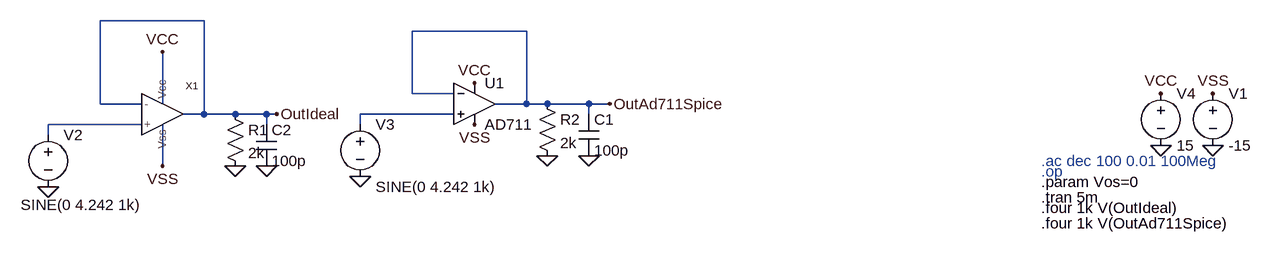
[diagram p0: schematic THD.asc]
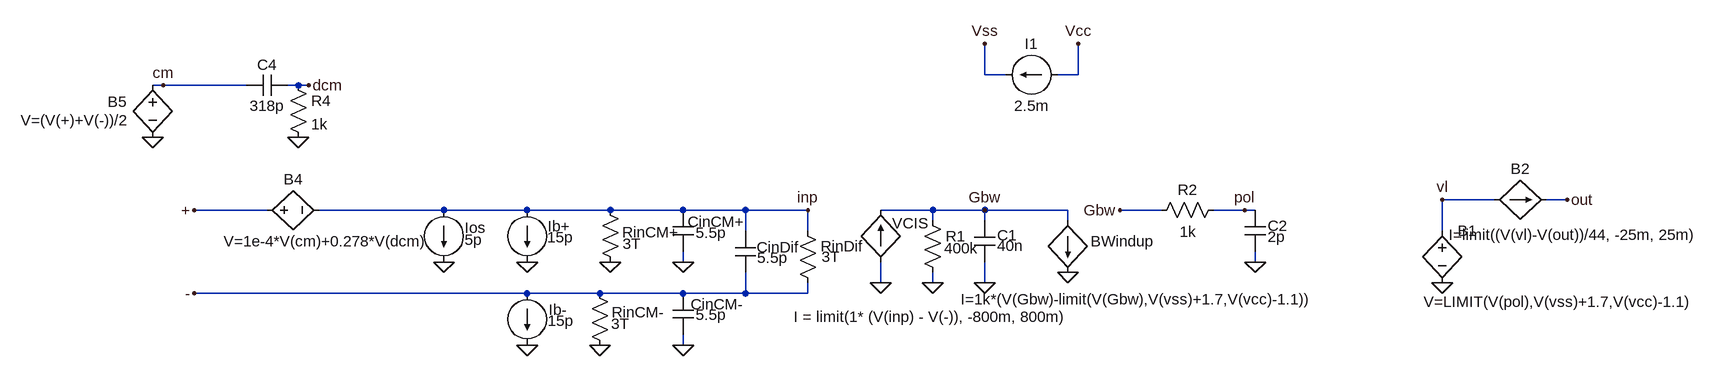
[diagram p1: sub-circuit aoideal.asc]
THD.asc, the LTspice schematic file:
Version 4.1
SHEET 1 1100 680
WIRE -512 -144 -672 -144
WIRE -16 -128 -192 -128
WIRE -192 -32 -192 -128
WIRE -128 -32 -192 -32
WIRE -672 -16 -672 -144
WIRE -608 -16 -672 -16
WIRE -576 -16 -576 -96
WIRE -16 -16 -16 -128
WIRE -16 -16 -64 -16
WIRE 16 -16 -16 -16
WIRE 80 -16 16 -16
WIRE 112 -16 80 -16
WIRE -512 0 -512 -144
WIRE -512 0 -544 0
WIRE -464 0 -512 0
WIRE -416 0 -464 0
WIRE -400 0 -416 0
WIRE -128 0 -272 0
WIRE 80 0 80 -16
WIRE -608 16 -752 16
WIRE -416 16 -416 0
WIRE -272 16 -272 0
WIRE -752 32 -752 16
WIRE -576 80 -576 16
FLAG 960 48 0
FLAG 1040 48 0
FLAG 960 -32 VCC
FLAG 1040 -32 VSS
FLAG -96 -48 VCC
FLAG -576 -96 VCC
FLAG -576 80 VSS
FLAG -96 16 VSS
FLAG -400 0 OutIdeal
FLAG 112 -16 OutAd711Spice
FLAG -752 112 0
FLAG -272 96 0
FLAG 80 64 0
FLAG 16 64 0
FLAG -464 80 0
FLAG -416 80 0
SYMBOL OpAmps\\AD711 -96 -80 R0
SYMATTR InstName U1
SYMBOL AoIdeal -608 0 R0
SYMATTR InstName X1
SYMBOL voltage 1040 -48 R0
SYMATTR InstName V1
SYMATTR Value -15
SYMBOL voltage -752 16 R0
WINDOW 123 -42 124 Left 2
WINDOW 39 0 0 Left 0
SYMATTR Value2 SINE(0 4.242 1k)
SYMATTR InstName V2
SYMATTR Value ""
SYMBOL voltage -272 0 R0
WINDOW 123 24 112 Left 2
WINDOW 39 0 0 Left 0
SYMATTR Value2 SINE(0 4.242 1k)
SYMATTR InstName V3
SYMATTR Value ""
SYMBOL res -480 -16 R0
SYMATTR InstName R1
SYMATTR Value 2k
SYMBOL res 0 -32 R0
SYMATTR InstName R2
SYMATTR Value 2k
SYMBOL cap 64 0 R0
SYMATTR InstName C1
SYMATTR Value 100p
SYMBOL cap -432 16 R0
SYMATTR InstName C2
SYMATTR Value 100p
SYMBOL voltage 960 -48 R0
SYMATTR InstName V4
SYMATTR Value 15
TEXT 776 88 Left 2 ;.op
TEXT 776 72 Left 2 ;.ac dec 100 0.01 100Meg
TEXT 776 104 Left 2 !.param Vos=0
TEXT 776 128 Left 2 !.tran 5m
TEXT 776 144 Left 2 !.four 1k V(OutIdeal)
TEXT 776 168 Left 2 !.four 1k V(OutAd711Spice)

aoideal.asc, the sub-circuit schematic file:
Version 4.1
SHEET 1 2688 1516
WIRE 272 -128 272 -176
WIRE 304 -128 272 -128
WIRE 416 -128 416 -176
WIRE 416 -128 384 -128
WIRE -992 -112 -1008 -112
WIRE -864 -112 -992 -112
WIRE -784 -112 -800 -112
WIRE -768 -112 -784 -112
WIRE 1056 64 976 64
WIRE 1168 64 1136 64
WIRE -832 80 -944 80
WIRE -560 80 -752 80
WIRE -432 80 -560 80
WIRE -304 80 -432 80
WIRE -192 80 -304 80
WIRE -96 80 -192 80
WIRE 0 80 -96 80
WIRE 192 80 112 80
WIRE 272 80 192 80
WIRE 400 80 272 80
WIRE 544 80 480 80
WIRE 672 80 624 80
WIRE 688 80 672 80
WIRE 192 96 192 80
WIRE 272 96 272 80
WIRE 400 96 400 80
WIRE -96 112 -96 80
WIRE 0 112 0 80
WIRE 976 112 976 64
WIRE -192 160 -192 144
WIRE 688 160 688 144
WIRE 112 192 112 160
WIRE 192 192 192 176
WIRE 272 192 272 160
WIRE -432 208 -944 208
WIRE -320 208 -432 208
WIRE -192 208 -320 208
WIRE -96 208 -96 176
WIRE -96 208 -192 208
WIRE 0 208 0 192
WIRE 0 208 -96 208
WIRE -192 288 -192 272
FLAG 112 192 0
FLAG -944 208 -
FLAG -944 80 +
FLAG 192 192 0
FLAG 272 192 0
FLAG -192 160 0
FLAG -304 160 0
FLAG -432 160 0
FLAG -560 160 0
FLAG -432 288 0
FLAG -320 288 0
FLAG -192 288 0
FLAG 0 80 inp
FLAG 272 80 Gbw
FLAG 480 80 Gbw
FLAG 688 160 0
FLAG 672 80 pol
FLAG 976 192 0
FLAG 416 -176 Vcc
FLAG 272 -176 Vss
FLAG 1168 64 out
FLAG 400 176 0
FLAG 976 64 vl
FLAG -1008 -32 0
FLAG -992 -112 cm
FLAG -768 -112 dcm
FLAG -784 -32 0
SYMBOL bi 112 160 R180
WINDOW 0 -73 60 Left 2
WINDOW 3 -289 -84 Left 2
SYMATTR InstName VCIS
SYMATTR Value I = limit(1* (V(inp) - V(-)), -800m, 800m)
SYMBOL res 176 80 R0
WINDOW 3 34 59 Left 2
SYMATTR Value 400k
SYMATTR InstName R1
SYMBOL cap 256 96 R0
WINDOW 0 35 23 Left 2
WINDOW 3 35 39 Left 2
SYMATTR InstName C1
SYMATTR Value 40n
SYMBOL current -560 80 R0
WINDOW 0 32 27 Left 2
WINDOW 3 32 46 Left 2
SYMATTR InstName Ios
SYMATTR Value 5p
SYMBOL current -432 80 R0
WINDOW 0 32 25 Left 2
WINDOW 3 31 42 Left 2
SYMATTR InstName Ib+
SYMATTR Value 15p
SYMBOL current -432 208 R0
WINDOW 0 33 25 Left 2
WINDOW 3 32 42 Left 2
SYMATTR InstName Ib-
SYMATTR Value 15p
SYMBOL res -320 64 R0
WINDOW 0 34 50 Left 2
WINDOW 3 35 68 Left 2
SYMATTR InstName RinCM+
SYMATTR Value 3T
SYMBOL res -336 192 R0
WINDOW 0 34 45 Left 2
WINDOW 3 33 63 Left 2
SYMATTR InstName RinCM-
SYMATTR Value 3T
SYMBOL cap -208 208 R0
WINDOW 0 28 17 Left 2
WINDOW 3 35 33 Left 2
SYMATTR InstName CinCM-
SYMATTR Value 5.5p
SYMBOL cap -208 80 R0
WINDOW 0 23 18 Left 2
WINDOW 3 35 35 Left 2
SYMATTR InstName CinCM+
SYMATTR Value 5.5p
SYMBOL cap -112 112 R0
WINDOW 0 33 25 Left 2
WINDOW 3 34 41 Left 2
SYMATTR InstName CinDif
SYMATTR Value 5.5p
SYMBOL res -16 96 R0
WINDOW 3 37 56 Left 2
SYMATTR Value 3T
SYMATTR InstName RinDif
SYMBOL res 640 64 R90
WINDOW 0 0 56 VBottom 2
WINDOW 3 34 55 VTop 2
SYMATTR InstName R2
SYMATTR Value 1k
SYMBOL cap 672 80 R0
WINDOW 0 35 24 Left 2
WINDOW 3 35 41 Left 2
SYMATTR InstName C2
SYMATTR Value 2p
SYMBOL bv 976 96 R0
WINDOW 3 -29 125 Left 2
SYMATTR Value V=LIMIT(V(pol),V(vss)+1.7,V(vcc)-1.1)
SYMATTR InstName B1
SYMBOL current 384 -128 R90
WINDOW 0 -32 40 VBottom 2
WINDOW 3 32 40 VTop 2
SYMATTR InstName I1
SYMATTR Value 2.5m
SYMBOL bi 400 96 R0
WINDOW 0 35 32 Left 2
WINDOW 3 -165 121 Left 2
SYMATTR InstName BWindup
SYMATTR Value I=1k*(V(Gbw)-limit(V(Gbw),V(vss)+1.7,V(vcc)-1.1))
SYMBOL bi 1056 64 R270
WINDOW 0 32 40 VTop 2
WINDOW 3 -38 122 VBottom 2
SYMATTR InstName B2
SYMATTR Value I=limit((V(vl)-V(out))/44, -25m, 25m)
SYMBOL bv -848 80 R270
WINDOW 0 32 56 VTop 2
WINDOW 3 -32 106 VBottom 2
SYMATTR InstName B4
SYMATTR Value V=1e-4*V(cm)+0.278*V(dcm)
SYMBOL bv -1008 -128 R0
WINDOW 0 -69 41 Left 2
WINDOW 3 -203 70 Left 2
SYMATTR InstName B5
SYMATTR Value V=(V(+)+V(-))/2
SYMBOL cap -864 -96 R270
WINDOW 0 32 32 VTop 2
WINDOW 3 0 32 VBottom 2
SYMATTR InstName C4
SYMATTR Value 318p
SYMBOL res -800 -128 R0
SYMATTR InstName R4
SYMATTR Value 1k

The netlist it stands for:
* THD.asc
X§U1 N001 OutAd711Spice VCC VSS OutAd711Spice AD712  ; pins In+ In- V+ V- OUT
X§X1 OutIdeal N002 OutIdeal VCC VSS aoideal
V1 VSS 0 -15
V2 N002 0 SINE(0 4.242 1k)
V3 N001 0 SINE(0 4.242 1k)
R1 OutIdeal 0 2k
R2 OutAd711Spice 0 2k
C1 OutAd711Spice 0 100p
C2 OutIdeal 0 100p
V4 VCC 0 15

* block symbol definitions
.subckt aoideal - + Out Vcc Vss
B§VCIS 0 Gbw I = limit(1* (V(inp) - V(-)), -800m, 800m)
R1 Gbw 0 400k
C1 Gbw 0 40n
Ios inp 0 5p
Ib+ inp 0 15p
Ib- - 0 15p
RinCM+ inp 0 3T
RinCM- - 0 3T
CinCM- - 0 5.5p
CinCM+ inp 0 5.5p
CinDif inp - 5.5p
RinDif inp - 3T
R2 pol Gbw 1k
C2 pol 0 2p
B1 vl 0 V=LIMIT(V(pol),V(vss)+1.7,V(vcc)-1.1)
I1 Vcc Vss 2.5m
BWindup Gbw 0 I=1k*(V(Gbw)-limit(V(Gbw),V(vss)+1.7,V(vcc)-1.1))
B2 vl out I=limit((V(vl)-V(out))/44, -25m, 25m)
B4 + inp V=1e-4*V(cm)+0.278*V(dcm)
B5 cm 0 V=(V(+)+V(-))/2
C4 cm dcm 318p
R4 dcm 0 1k
.ends aoideal

* .op
* .ac dec 100 0.01 100Meg
.param Vos=0
.tran 5m
.four 1k V(OutIdeal)
.four 1k V(OutAd711Spice)
.lib ADI1.lib
.backanno
.end

* Results of the author's LTspice run, read from the files saved beside the schematic
* Operating Point, zero values left out:
*   V(vcc) = 15 V
*   V(vss) = -15 V
*   I(V1) = 7.399 mA
*   I(V2) = -20 pA
*   I(V3) = -25 pA
*   I(V4) = -7.399 mA
*   Ix(u1:1) = 25 pA
*   Ix(u1:2) = 25 pA
*   Ix(u1:3) = 4.899 mA
*   Ix(u1:4) = -4.899 mA
*   Ix(u1:5) = -25 pA
*   Ix(x1:+) = 20 pA
*   Ix(x1:-) = 15 pA
*   Ix(x1:out) = -15 pA
*   Ix(x1:vcc) = 2.5 mA
*   Ix(x1:vss) = -2.5 mA
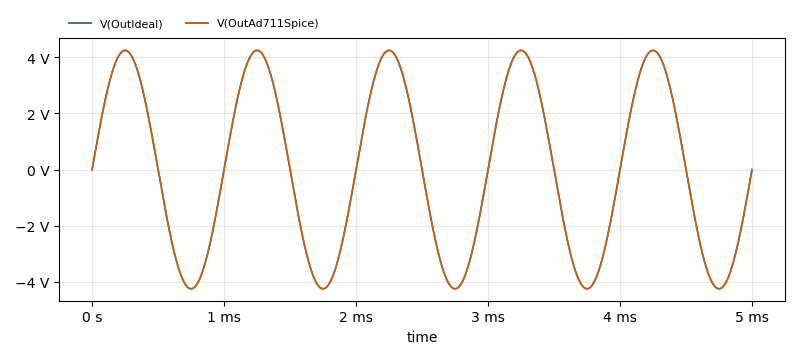
[diagram p2: Transient Analysis of THD.asc, plotted from the saved traces]
* Transient Analysis, 1 run:
*   V(OutIdeal): min -4.242 V, max 4.242 V, average 0 V, rms 3 V, last -1.09 mV
*   V(OutAd711Spice): min -4.242 V, max 4.242 V, average 0 V, rms 3 V, last -996.9 µV
* From the log:
*   Fourier components of V(OutIdeal)
*   N-Period=1
*   DC component:-2.55944e-07
*   Harmonic  Frequency   Fourier   Normalized   Phase    Normalized
*    Number     [Hz]     Component   Component  [degree]  Phase [deg]
*       1      1.000e+03   4.242e+00   1.000e+00     90.01°      0.00°
*       2      2.000e+03   4.211e-07   9.928e-08    -10.44°   -100.46°
*       3      3.000e+03   1.621e-05   3.822e-06    104.17°     14.15°
*       4      4.000e+03   2.678e-07   6.313e-08    153.71°     63.69°
*       5      5.000e+03   1.051e-05   2.478e-06    -66.74°   -156.75°
*       6      6.000e+03   2.008e-07   4.735e-08    -87.31°   -177.32°
*       7      7.000e+03   4.782e-06   1.127e-06    122.46°     32.44°
*       8      8.000e+03   1.239e-07   2.920e-08     69.73°    -20.28°
*       9      9.000e+03   1.168e-06   2.754e-07    -51.38°   -141.39°
*   Partial Harmonic Distortion: 0.000470%
*   Total Harmonic Distortion:   0.000000%
*   Fourier components of V(OutAd711Spice)
*   N-Period=1
*   DC component:-2.58148e-07
*   Harmonic  Frequency   Fourier   Normalized   Phase    Normalized
*    Number     [Hz]     Component   Component  [degree]  Phase [deg]
*       1      1.000e+03   4.242e+00   1.000e+00     90.01°      0.00°
*       2      2.000e+03   4.086e-07   9.633e-08     -9.44°    -99.45°
*       3      3.000e+03   3.296e-05   7.770e-06    151.52°     61.51°
*       4      4.000e+03   2.575e-07   6.071e-08    152.07°     62.06°
*       5      5.000e+03   1.070e-05   2.523e-06   -115.55°   -205.57°
*       6      6.000e+03   2.062e-07   4.861e-08    -87.22°   -177.23°
*       7      7.000e+03   7.151e-06   1.686e-06    145.48°     55.46°
*       8      8.000e+03   1.220e-07   2.877e-08     66.81°    -23.20°
*       9      9.000e+03   1.076e-06   2.537e-07   -122.96°   -212.98°
*   Partial Harmonic Distortion: 0.000835%
*   Total Harmonic Distortion:   0.000000%